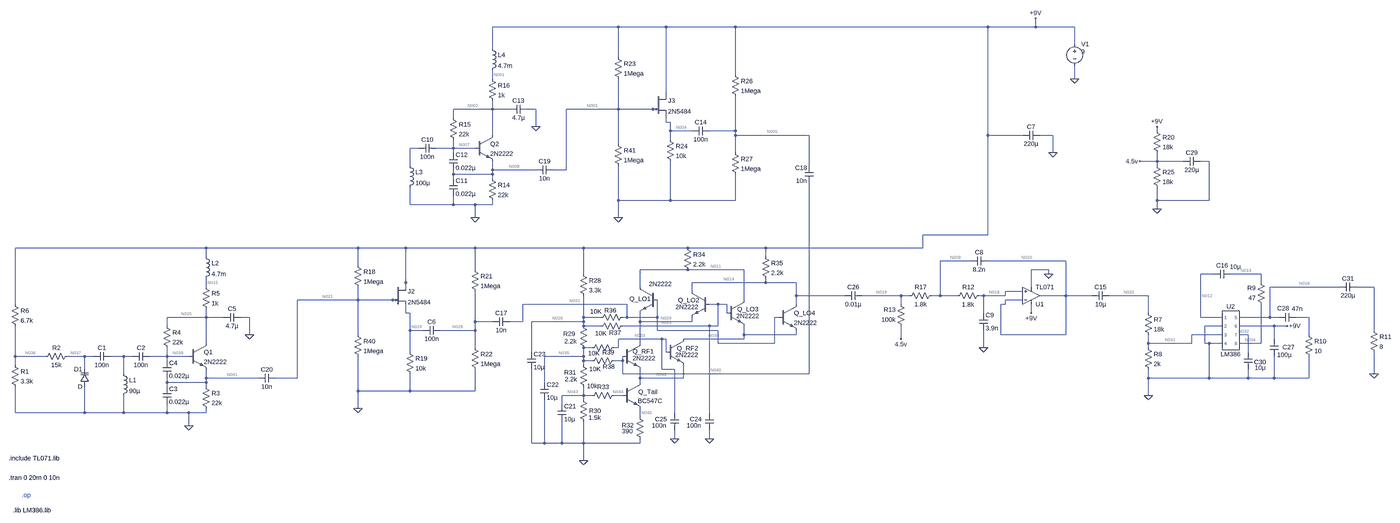
[diagram p0: schematic schm.asc, whole sheet]
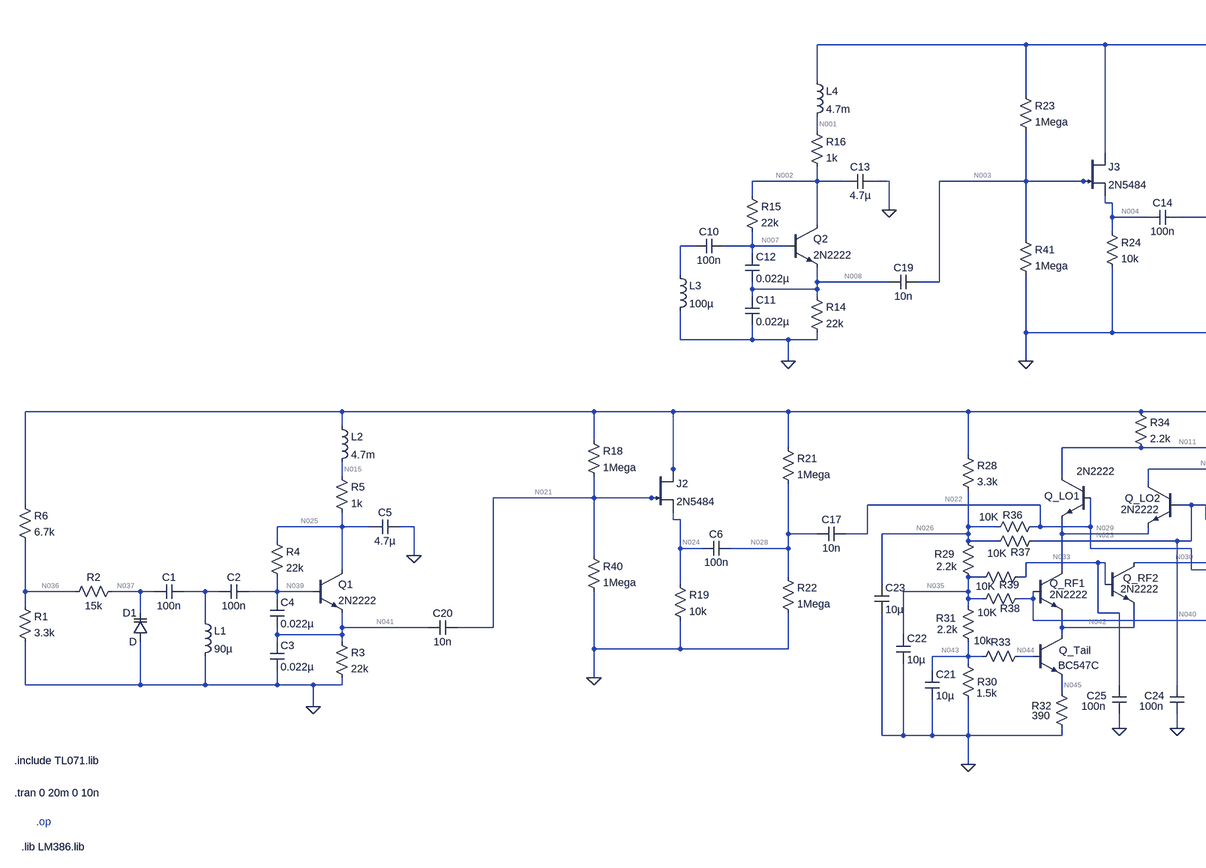
[diagram p1: schematic schm.asc, part, row 1 of 1, column 1 of 2]
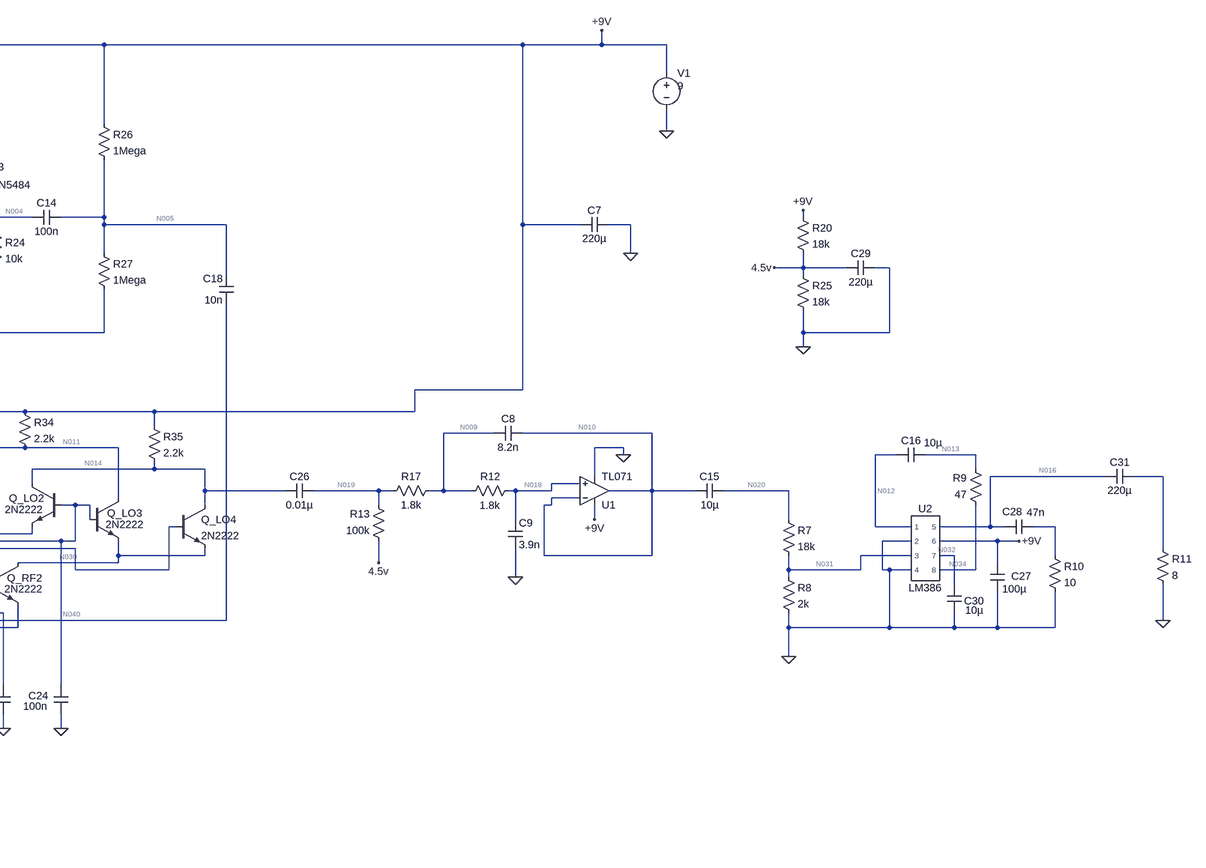
[diagram p2: schematic schm.asc, part, row 1 of 1, column 2 of 2]
schm.asc, the LTspice schematic file:
Version 4.1
SHEET 1 2980 824
WIRE -256 -976 -720 -976
WIRE -80 -976 -256 -976
WIRE 176 -976 -80 -976
WIRE 1120 -976 176 -976
WIRE 1296 -976 1296 -1008
WIRE 1296 -976 1120 -976
WIRE 1440 -976 1296 -976
WIRE 1440 -912 1440 -976
WIRE -720 -896 -720 -976
WIRE -256 -864 -256 -976
WIRE 176 -800 176 -976
WIRE -720 -784 -720 -816
WIRE 1440 -784 1440 -832
WIRE -80 -736 -80 -976
WIRE -720 -672 -720 -704
WIRE -720 -672 -864 -672
WIRE -656 -672 -720 -672
WIRE -560 -672 -592 -672
WIRE -256 -672 -256 -784
WIRE -256 -672 -448 -672
WIRE -128 -672 -256 -672
WIRE -112 -672 -128 -672
WIRE -864 -640 -864 -672
WIRE -80 -624 -80 -640
WIRE -64 -624 -80 -624
WIRE -560 -608 -560 -672
WIRE -64 -592 -64 -624
WIRE 16 -592 -64 -592
WIRE 176 -592 176 -720
WIRE 176 -592 80 -592
WIRE 1744 -592 1744 -608
WIRE -720 -576 -720 -672
WIRE 176 -576 176 -592
WIRE 448 -576 176 -576
WIRE 1120 -576 1120 -976
WIRE 1248 -576 1120 -576
WIRE 1360 -576 1312 -576
WIRE -64 -560 -64 -592
WIRE -256 -544 -256 -672
WIRE -992 -528 -1024 -528
WIRE -864 -528 -864 -560
WIRE -864 -528 -928 -528
WIRE -784 -528 -864 -528
WIRE -864 -512 -864 -528
WIRE 176 -512 176 -576
WIRE 1360 -512 1360 -576
WIRE 1744 -480 1744 -512
WIRE 1744 -480 1680 -480
WIRE 1840 -480 1744 -480
WIRE 1936 -480 1904 -480
WIRE -1024 -464 -1024 -528
WIRE 448 -464 448 -576
WIRE 1744 -464 1744 -480
WIRE -720 -448 -720 -480
WIRE -560 -448 -720 -448
WIRE -448 -448 -448 -672
WIRE -448 -448 -496 -448
WIRE -864 -432 -864 -448
WIRE -720 -432 -720 -448
WIRE -720 -432 -864 -432
WIRE -864 -416 -864 -432
WIRE -720 -416 -720 -432
WIRE -256 -336 -256 -464
WIRE -64 -336 -64 -480
WIRE -64 -336 -256 -336
WIRE 176 -336 176 -432
WIRE 176 -336 -64 -336
WIRE 1744 -336 1744 -384
WIRE 1936 -336 1936 -480
WIRE 1936 -336 1744 -336
WIRE -1024 -320 -1024 -384
WIRE -864 -320 -864 -352
WIRE -864 -320 -1024 -320
WIRE -784 -320 -864 -320
WIRE -720 -320 -720 -336
WIRE -720 -320 -784 -320
WIRE 1744 -304 1744 -336
WIRE -784 -272 -784 -320
WIRE -256 -272 -256 -336
WIRE 1120 -208 1120 -576
WIRE 1120 -208 880 -208
WIRE -1776 -160 -2480 -160
WIRE -1216 -160 -1776 -160
WIRE -1040 -160 -1216 -160
WIRE -784 -160 -1040 -160
WIRE -384 -160 -784 -160
WIRE 0 -160 -384 -160
WIRE 288 -160 0 -160
WIRE 880 -160 880 -208
WIRE 880 -160 288 -160
WIRE -1776 -128 -1776 -160
WIRE 288 -128 288 -160
WIRE 1056 -112 944 -112
WIRE 1408 -112 1120 -112
WIRE -1216 -96 -1216 -160
WIRE -784 -80 -784 -160
WIRE 0 -80 -176 -80
WIRE 208 -80 0 -80
WIRE 1344 -80 1280 -80
WIRE -384 -64 -384 -160
WIRE 1344 -64 1344 -80
WIRE 1952 -64 1904 -64
WIRE 2128 -64 2016 -64
WIRE -1040 -32 -1040 -160
WIRE 288 -32 288 -48
WIRE 288 -32 16 -32
WIRE 400 -32 288 -32
WIRE 2128 -32 2128 -64
WIRE -1776 -16 -1776 -48
WIRE -1040 -16 -1040 -32
WIRE -176 -16 -176 -80
WIRE 1280 -16 1280 -80
WIRE 2416 -16 2160 -16
WIRE 2544 -16 2480 -16
WIRE 16 0 16 -32
WIRE 1248 0 1184 0
WIRE 400 16 400 -32
WIRE 592 16 400 16
WIRE 800 16 656 16
WIRE 832 16 800 16
WIRE 944 16 944 -112
WIRE 944 16 912 16
WIRE 1008 16 944 16
WIRE 1104 16 1088 16
WIRE 1184 16 1184 0
WIRE 1184 16 1104 16
WIRE 1408 16 1408 -112
WIRE 1408 16 1312 16
WIRE 1504 16 1408 16
WIRE 1712 16 1568 16
WIRE -1216 32 -1216 -16
WIRE -1216 32 -1440 32
WIRE -1088 32 -1216 32
WIRE -1072 32 -1088 32
WIRE 208 32 208 -80
WIRE 1248 32 1184 32
WIRE -2480 48 -2480 -160
WIRE -224 48 -608 48
WIRE 112 48 80 48
WIRE 144 48 112 48
WIRE 400 48 400 16
WIRE 800 48 800 16
WIRE 1184 48 1184 32
WIRE 1184 48 1168 48
WIRE -1040 80 -1040 64
WIRE -1024 80 -1040 80
WIRE 144 80 144 48
WIRE 1104 80 1104 16
WIRE 1280 80 1280 48
WIRE 1712 80 1712 16
WIRE -1776 96 -1776 64
WIRE -1776 96 -1920 96
WIRE -1712 96 -1776 96
WIRE -1616 96 -1648 96
WIRE -384 96 -384 16
WIRE -320 96 -384 96
WIRE -224 96 -224 48
WIRE -224 96 -240 96
WIRE -112 96 -112 32
WIRE -112 96 -224 96
WIRE 336 96 320 96
WIRE 1904 96 1904 -64
WIRE 1984 96 1904 96
WIRE 2160 96 2160 -16
WIRE 2160 96 2048 96
WIRE 2192 96 2160 96
WIRE 2304 96 2256 96
WIRE -784 112 -784 0
WIRE -720 112 -784 112
WIRE -608 112 -608 48
WIRE -608 112 -656 112
WIRE -384 112 -384 96
WIRE -384 112 -576 112
WIRE -176 112 -176 80
WIRE 16 112 16 96
WIRE 16 112 -176 112
WIRE -1920 128 -1920 96
WIRE -384 128 -384 112
WIRE -320 128 -384 128
WIRE 80 128 -240 128
WIRE 112 128 112 48
WIRE 112 128 80 128
WIRE 1984 128 1920 128
WIRE 2176 128 2048 128
WIRE 2224 128 2176 128
WIRE -1024 144 -1024 80
WIRE -976 144 -1024 144
WIRE -784 144 -784 112
WIRE -784 144 -912 144
WIRE -112 144 -112 96
WIRE 112 144 -112 144
WIRE 2544 144 2544 -16
WIRE -1616 160 -1616 96
WIRE -1216 160 -1216 32
WIRE 208 160 208 128
WIRE 400 160 400 144
WIRE 400 160 208 160
WIRE 1168 160 1168 48
WIRE 1408 160 1408 16
WIRE 1408 160 1168 160
WIRE 1984 160 1872 160
WIRE 2080 160 2048 160
WIRE 2304 160 2304 96
WIRE -96 176 -256 176
WIRE -80 176 -96 176
WIRE 208 176 208 160
WIRE 208 176 -16 176
WIRE 800 176 800 128
WIRE 2176 176 2176 128
WIRE -1776 192 -1776 96
WIRE -176 192 -176 112
WIRE 112 192 112 144
WIRE 320 192 320 96
WIRE 320 192 112 192
WIRE 1712 192 1712 160
WIRE 1872 192 1872 160
WIRE 1872 192 1712 192
WIRE 1920 192 1920 128
WIRE 1936 192 1920 192
WIRE 1984 192 1936 192
WIRE 2128 192 2128 48
WIRE 2128 192 2048 192
WIRE -784 208 -784 144
WIRE -352 208 -384 208
WIRE -256 208 -256 176
WIRE -256 208 -272 208
WIRE 1104 208 1104 144
WIRE 1712 208 1712 192
WIRE -1024 224 -1024 144
WIRE -576 224 -576 112
WIRE -80 224 -80 176
WIRE 2080 224 2080 160
WIRE -2480 240 -2480 128
WIRE -2368 240 -2480 240
WIRE -2224 240 -2288 240
WIRE -2192 240 -2224 240
WIRE -2080 240 -2128 240
WIRE -2048 240 -2080 240
WIRE -1920 240 -1920 208
WIRE -1920 240 -1984 240
WIRE -1840 240 -1920 240
WIRE -384 240 -384 208
WIRE -384 240 -528 240
WIRE -1920 256 -1920 240
WIRE -384 256 -384 240
WIRE -352 256 -384 256
WIRE -240 256 -240 240
WIRE -240 256 -272 256
WIRE -2480 272 -2480 240
WIRE -384 272 -384 256
WIRE -2224 288 -2224 240
WIRE -96 288 -96 176
WIRE -48 288 -96 288
WIRE -2080 304 -2080 240
WIRE -240 304 -240 256
WIRE 448 304 448 -400
WIRE 448 304 -240 304
WIRE 2544 304 2544 224
WIRE -1776 320 -1776 288
WIRE -1584 320 -1776 320
WIRE -1440 320 -1440 32
WIRE -1440 320 -1520 320
WIRE -176 320 -176 288
WIRE -16 320 -16 272
WIRE -16 320 -176 320
WIRE 1712 320 1712 288
WIRE 1936 320 1936 192
WIRE 1936 320 1712 320
WIRE 2080 320 2080 288
WIRE 2080 320 1936 320
WIRE 2176 320 2176 240
WIRE 2176 320 2080 320
WIRE 2304 320 2304 240
WIRE 2304 320 2176 320
WIRE -1920 336 -1920 320
WIRE -1776 336 -1776 320
WIRE -1776 336 -1920 336
WIRE -528 336 -528 240
WIRE -176 336 -176 320
WIRE -1920 352 -1920 336
WIRE -1776 352 -1776 336
WIRE -1216 368 -1216 240
WIRE -1024 368 -1024 304
WIRE -1024 368 -1216 368
WIRE -784 368 -784 288
WIRE -784 368 -1024 368
WIRE -384 384 -384 352
WIRE -384 384 -464 384
WIRE -352 384 -384 384
WIRE -240 384 -272 384
WIRE 1712 384 1712 320
WIRE -384 400 -384 384
WIRE -464 416 -464 384
WIRE -1216 432 -1216 368
WIRE -2480 448 -2480 352
WIRE -2224 448 -2224 352
WIRE -2224 448 -2480 448
WIRE -2080 448 -2080 384
WIRE -2080 448 -2224 448
WIRE -1920 448 -1920 416
WIRE -1920 448 -2080 448
WIRE -1840 448 -1920 448
WIRE -1776 448 -1776 432
WIRE -1776 448 -1840 448
WIRE -48 448 -48 288
WIRE 80 448 80 128
WIRE -176 464 -176 432
WIRE -1840 496 -1840 448
WIRE -48 544 -48 512
WIRE 80 544 80 512
WIRE -576 560 -576 288
WIRE -528 560 -528 400
WIRE -528 560 -576 560
WIRE -464 560 -464 480
WIRE -464 560 -528 560
WIRE -384 560 -384 480
WIRE -384 560 -464 560
WIRE -176 560 -176 544
WIRE -176 560 -384 560
WIRE -384 624 -384 560
FLAG -1840 496 0
FLAG -1616 160 0
FLAG 1440 -784 0
FLAG 1360 -512 0
FLAG 1296 -1008 +9V
FLAG 1280 80 +9V
FLAG 1104 208 0
FLAG -784 -272 0
FLAG -560 -608 0
FLAG -1216 432 0
FLAG -256 -272 0
FLAG -384 624 0
FLAG 80 544 0
FLAG -48 544 0
FLAG 1712 384 0
FLAG 2224 128 +9V
FLAG 2544 304 0
FLAG 1344 -64 0
FLAG 1744 -608 +9V
FLAG 1744 -304 0
FLAG 1680 -480 4.5v
FLAG 800 176 4.5v
SYMBOL res -2496 256 R0
SYMATTR InstName R1
SYMATTR Value 3.3k
SYMBOL res -2272 224 R90
WINDOW 0 0 56 VBottom 2
WINDOW 3 32 56 VTop 2
SYMATTR InstName R2
SYMATTR Value 15k
SYMBOL varactor -2208 352 R180
WINDOW 0 24 64 Left 2
WINDOW 3 24 0 Left 2
SYMATTR InstName D1
SYMBOL cap -2128 224 R90
WINDOW 0 0 32 VBottom 2
WINDOW 3 32 32 VTop 2
SYMATTR InstName C1
SYMATTR Value 100n
SYMBOL cap -1984 224 R90
WINDOW 0 0 32 VBottom 2
WINDOW 3 32 32 VTop 2
SYMATTR InstName C2
SYMATTR Value 100n
SYMBOL ind -2096 288 R0
SYMATTR InstName L1
SYMATTR Value 90µ
SYMATTR SpiceLine Rser=1m
SYMBOL cap -1936 352 R0
SYMATTR InstName C3
SYMATTR Value 0.022µ
SYMATTR SpiceLine V=50 Irms=0 Rser=0.0255 Lser=380p mfg="Würth Elektronik" pn="885012010015 WCAP-CSGP 1812" type="NP0"
SYMBOL cap -1936 256 R0
SYMATTR InstName C4
SYMATTR Value 0.022µ
SYMATTR SpiceLine V=10 Irms=0 Rser=0.0114 Lser=862p mfg="Würth Elektronik" pn="885012008009 WCAP-CSGP 1206" type="NP0"
SYMBOL res -1792 336 R0
SYMATTR InstName R3
SYMATTR Value 22k
SYMBOL res -1936 112 R0
SYMATTR InstName R4
SYMATTR Value 22k
SYMBOL npn -1840 192 R0
SYMATTR InstName Q1
SYMATTR Value 2N2222
SYMBOL res -1792 -32 R0
SYMATTR InstName R5
SYMATTR Value 1k
SYMBOL res -2496 32 R0
SYMATTR InstName R6
SYMATTR Value 6.7k
SYMBOL cap -1648 80 R90
WINDOW 0 0 32 VBottom 2
WINDOW 3 32 32 VTop 2
SYMATTR InstName C5
SYMATTR Value 4.7µ
SYMBOL voltage 1440 -928 R0
WINDOW 3 24 44 Left 2
WINDOW 123 0 0 Left 0
WINDOW 39 0 0 Left 0
SYMATTR Value 9
SYMATTR InstName V1
SYMBOL cap 1312 -592 R90
WINDOW 0 0 32 VBottom 2
WINDOW 3 32 32 VTop 2
SYMATTR InstName C7
SYMATTR Value 220µ
SYMBOL res 1104 0 R90
WINDOW 0 0 56 VBottom 2
WINDOW 3 33 57 VTop 2
SYMATTR InstName R12
SYMATTR Value 1.8k
SYMBOL cap 1120 -128 R90
WINDOW 0 0 32 VBottom 2
WINDOW 3 32 32 VTop 2
SYMATTR InstName C8
SYMATTR Value 8.2n
SYMBOL cap 1088 80 R0
SYMATTR InstName C9
SYMATTR Value 3.9n
SYMBOL OpAmps\\opamp2 1280 80 M180
SYMATTR InstName U1
SYMATTR Value TL071
SYMBOL res 816 144 R180
WINDOW 0 36 76 Left 2
WINDOW 3 36 40 Left 2
SYMATTR InstName R13
SYMATTR Value 100k
SYMBOL ind -1792 -144 R0
SYMATTR InstName L2
SYMATTR Value 4.7m
SYMATTR SpiceLine Ipk=0.2 Rser=10.98 Rpar=358840 Cpar=6.93p mfg="Würth Elektronik" pn="7447721047 WE-TI 8075"
SYMBOL cap -928 -544 R90
WINDOW 0 0 32 VBottom 2
WINDOW 3 32 32 VTop 2
SYMATTR InstName C10
SYMATTR Value 100n
SYMBOL ind -1040 -480 R0
SYMATTR InstName L3
SYMATTR Value 100µ
SYMATTR SpiceLine Rser=1m
SYMBOL cap -880 -416 R0
SYMATTR InstName C11
SYMATTR Value 0.022µ
SYMATTR SpiceLine V=50 Irms=0 Rser=0.0255 Lser=380p mfg="Würth Elektronik" pn="885012010015 WCAP-CSGP 1812" type="NP0"
SYMBOL cap -880 -512 R0
SYMATTR InstName C12
SYMATTR Value 0.022µ
SYMATTR SpiceLine V=10 Irms=0 Rser=0.0114 Lser=862p mfg="Würth Elektronik" pn="885012008009 WCAP-CSGP 1206" type="NP0"
SYMBOL res -736 -432 R0
SYMATTR InstName R14
SYMATTR Value 22k
SYMBOL res -880 -656 R0
SYMATTR InstName R15
SYMATTR Value 22k
SYMBOL npn -784 -576 R0
SYMATTR InstName Q2
SYMATTR Value 2N2222
SYMBOL res -736 -800 R0
SYMATTR InstName R16
SYMATTR Value 1k
SYMBOL cap -592 -688 R90
WINDOW 0 0 32 VBottom 2
WINDOW 3 32 32 VTop 2
SYMATTR InstName C13
SYMATTR Value 4.7µ
SYMBOL ind -736 -912 R0
SYMATTR InstName L4
SYMATTR Value 4.7m
SYMATTR SpiceLine Ipk=0.2 Rser=10.98 Rpar=358840 Cpar=6.93p mfg="Würth Elektronik" pn="7447721047 WE-TI 8075"
SYMBOL res 928 0 R90
WINDOW 0 0 56 VBottom 2
WINDOW 3 32 56 VTop 2
SYMATTR InstName R17
SYMATTR Value 1.8k
SYMBOL res -1232 -112 R0
SYMATTR InstName R18
SYMATTR Value 1Mega
SYMBOL res -1040 208 R0
SYMATTR InstName R19
SYMATTR Value 10k
SYMBOL njf -1088 -32 R0
SYMATTR InstName J2
SYMATTR Value 2N5484
SYMBOL res -800 -96 R0
SYMATTR InstName R21
SYMATTR Value 1Mega
SYMBOL res -800 192 R0
SYMATTR InstName R22
SYMATTR Value 1Mega
SYMBOL res -272 -880 R0
SYMATTR InstName R23
SYMATTR Value 1Mega
SYMBOL res -80 -576 R0
SYMATTR InstName R24
SYMATTR Value 10k
SYMBOL njf -128 -736 R0
SYMATTR InstName J3
SYMATTR Value 2N5484
SYMBOL res 160 -816 R0
SYMATTR InstName R26
SYMATTR Value 1Mega
SYMBOL res 160 -528 R0
SYMATTR InstName R27
SYMATTR Value 1Mega
SYMBOL cap -656 96 R90
WINDOW 0 0 32 VBottom 2
WINDOW 3 32 32 VTop 2
SYMATTR InstName C17
SYMATTR Value 10n
SYMATTR SpiceLine V=10 Irms=0 Rser=0.025 Lser=913p
SYMBOL cap 464 -400 R180
WINDOW 0 24 56 Left 2
WINDOW 3 24 8 Left 2
SYMATTR InstName C18
SYMATTR Value 10n
SYMATTR SpiceLine V=10 Irms=0 Rser=0.025 Lser=913p
SYMBOL cap -560 -432 R270
WINDOW 0 32 32 VTop 2
WINDOW 3 0 32 VBottom 2
SYMATTR InstName C19
SYMATTR Value 10n
SYMATTR SpiceLine V=10 Irms=0 Rser=0.025 Lser=913p mfg="Würth Elektronik" pn="885012008008 WCAP-CSGP 1206" type="NP0"
SYMBOL cap -1520 304 R90
WINDOW 0 0 32 VBottom 2
WINDOW 3 32 32 VTop 2
SYMATTR InstName C20
SYMATTR Value 10n
SYMATTR SpiceLine V=10 Irms=0 Rser=0.025 Lser=913p mfg="Würth Elektronik" pn="885012008008 WCAP-CSGP 1206" type="NP0"
SYMBOL npn -240 192 R0
WINDOW 0 37 30 Left 2
WINDOW 3 37 55 Left 2
SYMATTR InstName Q_RF1
SYMATTR Value 2N2222
SYMBOL npn -240 336 R0
WINDOW 0 58 35 Left 2
SYMATTR InstName Q_Tail
SYMATTR Value BC547C
SYMBOL res -400 -80 R0
SYMATTR InstName R28
SYMATTR Value 3.3k
SYMBOL res -400 112 R0
WINDOW 0 -59 45 Left 2
WINDOW 3 -55 72 Left 2
SYMATTR InstName R29
SYMATTR Value 2.2k
SYMBOL res -400 384 R0
WINDOW 0 36 57 Left 2
WINDOW 3 34 82 Left 2
SYMATTR InstName R30
SYMATTR Value 1.5k
SYMBOL res -400 256 R0
WINDOW 0 -56 43 Left 2
WINDOW 3 -53 68 Left 2
SYMATTR InstName R31
SYMATTR Value 2.2k
SYMBOL cap -480 416 R0
SYMATTR Value 10µ
SYMATTR InstName C21
SYMATTR SpiceLine V=10 Irms=23m Rser=2.4699 Lser=942p mfg="Würth Elektronik" pn="865090240001 WCAP-ASLU 4x5,5" type="Al electrolytic"
SYMBOL cap -544 336 R0
SYMATTR Value 10µ
SYMATTR InstName C22
SYMATTR SpiceLine V=10 Irms=23m Rser=2.4699 Lser=942p mfg="Würth Elektronik" pn="865090240001 WCAP-ASLU 4x5,5" type="Al electrolytic"
SYMBOL cap -592 224 R0
SYMATTR Value 10µ
SYMATTR InstName C23
SYMATTR SpiceLine V=10 Irms=23m Rser=2.4699 Lser=942p mfg="Würth Elektronik" pn="865090240001 WCAP-ASLU 4x5,5" type="Al electrolytic"
SYMBOL res -192 448 R0
WINDOW 0 -51 46 Left 2
WINDOW 3 -50 68 Left 2
SYMATTR InstName R32
SYMATTR Value 390
SYMBOL res -256 368 R90
WINDOW 0 0 56 VBottom 2
WINDOW 3 -34 96 VTop 2
SYMATTR InstName R33
SYMATTR Value 10k
SYMBOL npn -80 176 R0
WINDOW 0 40 34 Left 2
WINDOW 3 34 58 Left 2
SYMATTR InstName Q_RF2
SYMATTR Value 2N2222
SYMBOL npn -112 -16 M0
WINDOW 0 25 44 Left 2
WINDOW 3 -54 -11 Left 2
SYMATTR InstName Q_LO1
SYMATTR Value 2N2222
SYMBOL npn 80 0 M0
WINDOW 0 38 33 Left 2
WINDOW 3 40 58 Left 2
SYMATTR InstName Q_LO2
SYMATTR Value 2N2222
SYMBOL npn 144 32 R0
WINDOW 0 39 34 Left 2
WINDOW 3 35 59 Left 2
SYMATTR InstName Q_LO3
SYMATTR Value 2N2222
SYMBOL npn 336 48 R0
SYMATTR InstName Q_LO4
SYMATTR Value 2N2222
SYMBOL res -16 -176 R0
SYMATTR InstName R34
SYMATTR Value 2.2k
SYMBOL res 272 -144 R0
SYMATTR InstName R35
SYMATTR Value 2.2k
SYMBOL res -224 80 R90
WINDOW 0 6 61 VBottom 2
WINDOW 3 -21 114 VTop 2
SYMATTR InstName R36
SYMATTR Value 10K
SYMATTR SpiceLine tol=1 pwr=0.1
SYMBOL res -224 112 R90
WINDOW 0 56 44 VBottom 2
WINDOW 3 28 96 VTop 2
SYMATTR InstName R37
SYMATTR Value 10K
SYMATTR SpiceLine tol=1 pwr=0.1
SYMBOL cap 96 512 R180
WINDOW 0 44 40 Left 2
WINDOW 3 46 17 Left 2
SYMATTR InstName C24
SYMATTR Value 100n
SYMATTR SpiceLine V=10 Irms=0 Rser=0.025 Lser=913p
SYMBOL res -256 240 R90
WINDOW 0 53 35 VBottom 2
WINDOW 3 31 86 VTop 2
SYMATTR InstName R38
SYMATTR Value 10K
SYMATTR SpiceLine tol=1 pwr=0.1
SYMBOL res -256 192 R90
WINDOW 0 49 37 VBottom 2
WINDOW 3 21 90 VTop 2
SYMATTR InstName R39
SYMATTR Value 10K
SYMATTR SpiceLine tol=1 pwr=0.1
SYMBOL cap -32 512 R180
WINDOW 0 44 40 Left 2
WINDOW 3 46 17 Left 2
SYMATTR InstName C25
SYMATTR Value 100n
SYMATTR SpiceLine V=10 Irms=0 Rser=0.025 Lser=913p
SYMBOL cap 656 0 R90
WINDOW 0 0 32 VBottom 2
WINDOW 3 32 32 VTop 2
SYMATTR InstName C26
SYMATTR Value 0.01µ
SYMATTR SpiceLine V=10 Irms=0 Rser=0.025 Lser=913p mfg="Würth Elektronik" pn="885012008008 WCAP-CSGP 1206" type="NP0"
SYMBOL cap -912 128 R90
WINDOW 0 0 32 VBottom 2
WINDOW 3 32 32 VTop 2
SYMATTR InstName C6
SYMATTR Value 100n
SYMBOL cap 80 -608 R90
WINDOW 0 0 32 VBottom 2
WINDOW 3 32 32 VTop 2
SYMATTR InstName C14
SYMATTR Value 100n
SYMBOL cap 1568 0 R90
WINDOW 0 0 32 VBottom 2
WINDOW 3 32 32 VTop 2
SYMATTR InstName C15
SYMATTR Value 10µ
SYMATTR SpiceLine V=10 Irms=0 Rser=0.025 Lser=913p
SYMBOL res 1696 64 R0
SYMATTR InstName R7
SYMATTR Value 18k
SYMBOL res 1696 192 R0
SYMATTR InstName R8
SYMATTR Value 2k
SYMBOL cap 2016 -80 R90
WINDOW 0 0 32 VBottom 2
WINDOW 3 -26 -17 VTop 2
SYMATTR InstName C16
SYMATTR Value 10µ
SYMATTR SpiceLine V=10 Irms=0 Rser=0.025 Lser=913p
SYMBOL res 2144 64 R180
WINDOW 0 36 76 Left 2
WINDOW 3 36 40 Left 2
SYMATTR InstName R9
SYMATTR Value 47
SYMBOL cap 2192 240 R180
WINDOW 0 -59 34 Left 2
WINDOW 3 -49 6 Left 2
SYMATTR InstName C27
SYMATTR Value 100µ
SYMATTR SpiceLine V=10 Irms=0 Rser=0.025 Lser=913p
SYMBOL cap 2192 112 R270
WINDOW 0 34 17 VTop 2
WINDOW 3 63 69 VBottom 2
SYMATTR InstName C28
SYMATTR Value 47n
SYMATTR SpiceLine V=10 Irms=0 Rser=0.025 Lser=913p
SYMBOL res 2528 128 R0
SYMATTR InstName R11
SYMATTR Value 8
SYMBOL res 2288 144 R0
SYMATTR InstName R10
SYMATTR Value 10
SYMBOL cap 2096 288 R180
WINDOW 0 -50 27 Left 2
WINDOW 3 -49 6 Left 2
SYMATTR InstName C30
SYMATTR Value 10µ
SYMATTR SpiceLine V=10 Irms=0 Rser=0.025 Lser=913p
SYMBOL cap 2416 0 R270
WINDOW 0 32 32 VTop 2
WINDOW 3 0 32 VBottom 2
SYMATTR InstName C31
SYMATTR Value 220µ
SYMATTR SpiceLine V=10 Irms=0 Rser=0.025 Lser=913p
SYMBOL LM386 2016 144 R0
SYMATTR InstName U2
SYMBOL res 1728 -608 R0
SYMATTR InstName R20
SYMATTR Value 18k
SYMBOL res 1728 -480 R0
SYMATTR InstName R25
SYMATTR Value 18k
SYMBOL cap 1904 -496 R90
WINDOW 0 0 32 VBottom 2
WINDOW 3 32 32 VTop 2
SYMATTR InstName C29
SYMATTR Value 220µ
SYMBOL res -1232 144 R0
SYMATTR InstName R40
SYMATTR Value 1Mega
SYMBOL res -272 -560 R0
SYMATTR InstName R41
SYMATTR Value 1Mega
TEXT -2504 688 Left 2 !.tran 0 20m 0 10n
TEXT -2504 616 Left 2 !.include TL071.lib
TEXT -2456 752 Left 2 ;.op
TEXT -2488 808 Left 2 !.lib LM386.lib

The netlist it stands for:
* schm.asc
R1 N036 0 3.3k
R2 N037 N036 15k
D1 0 N037 D
C1 N038 N037 100n
C2 N039 N038 100n
L1 N038 0 90µ Rser=1m
C3 N041 0 0.022µ V=50 Irms=0 Rser=0.0255 Lser=380p mfg="Würth Elektronik" pn="885012010015 WCAP-CSGP 1812" type="NP0"
C4 N039 N041 0.022µ V=10 Irms=0 Rser=0.0114 Lser=862p mfg="Würth Elektronik" pn="885012008009 WCAP-CSGP 1206" type="NP0"
R3 N041 0 22k
R4 N025 N039 22k
Q1 N025 N039 N041 0 2N2222
R5 N015 N025 1k
R6 +9V N036 6.7k
C5 0 N025 4.7µ
V1 +9V 0 9
C7 0 +9V 220µ
R12 N018 N009 1.8k
C8 N010 N009 8.2n
C9 N018 0 3.9n
X§U1 N018 N010 +9V 0 N010 TL071  ; pins In+ In- V+ V- OUT
R13 4.5v N019 100k
L2 +9V N015 4.7m Ipk=0.2 Rser=10.98 Rpar=358840 Cpar=6.93p mfg="Würth Elektronik" pn="7447721047 WE-TI 8075"
C10 N007 N006 100n
L3 N006 0 100µ Rser=1m
C11 N008 0 0.022µ V=50 Irms=0 Rser=0.0255 Lser=380p mfg="Würth Elektronik" pn="885012010015 WCAP-CSGP 1812" type="NP0"
C12 N007 N008 0.022µ V=10 Irms=0 Rser=0.0114 Lser=862p mfg="Würth Elektronik" pn="885012008009 WCAP-CSGP 1206" type="NP0"
R14 N008 0 22k
R15 N002 N007 22k
Q2 N002 N007 N008 0 2N2222
R16 N001 N002 1k
C13 0 N002 4.7µ
L4 +9V N001 4.7m Ipk=0.2 Rser=10.98 Rpar=358840 Cpar=6.93p mfg="Würth Elektronik" pn="7447721047 WE-TI 8075"
R17 N009 N019 1.8k
R18 +9V N021 1Mega
R19 N024 0 10k
J2 +9V N021 N024 2N5484
R21 +9V N028 1Mega
R22 N028 0 1Mega
R23 +9V N003 1Mega
R24 N004 0 10k
J3 +9V N003 N004 2N5484
R26 +9V N005 1Mega
R27 N005 0 1Mega
C17 N022 N028 10n V=10 Irms=0 Rser=0.025 Lser=913p
C18 N040 N005 10n V=10 Irms=0 Rser=0.025 Lser=913p
C19 N008 N003 10n V=10 Irms=0 Rser=0.025 Lser=913p mfg="Würth Elektronik" pn="885012008008 WCAP-CSGP 1206" type="NP0"
C20 N021 N041 10n V=10 Irms=0 Rser=0.025 Lser=913p mfg="Würth Elektronik" pn="885012008008 WCAP-CSGP 1206" type="NP0"
Q_RF1 N029 N040 N042 0 2N2222
Q_Tail N042 N044 N045 0 BC547C
R28 +9V N026 3.3k
R29 N026 N035 2.2k
R30 N043 0 1.5k
R31 N035 N043 2.2k
C21 N043 0 10µ V=10 Irms=23m Rser=2.4699 Lser=942p mfg="Würth Elektronik" pn="865090240001 WCAP-ASLU 4x5,5" type="Al electrolytic"
C22 N035 0 10µ V=10 Irms=23m Rser=2.4699 Lser=942p mfg="Würth Elektronik" pn="865090240001 WCAP-ASLU 4x5,5" type="Al electrolytic"
C23 N026 0 10µ V=10 Irms=23m Rser=2.4699 Lser=942p mfg="Würth Elektronik" pn="865090240001 WCAP-ASLU 4x5,5" type="Al electrolytic"
R32 N045 0 390
R33 N044 N043 10k
Q_RF2 N030 N033 N042 0 2N2222
Q_LO1 N011 N022 N029 0 2N2222
Q_LO2 N014 N023 N029 0 2N2222
Q_LO3 N011 N023 N030 0 2N2222
Q_LO4 N014 N022 N030 0 2N2222
R34 +9V N011 2.2k
R35 +9V N014 2.2k
R36 N022 N026 10K tol=1 pwr=0.1
R37 N023 N026 10K tol=1 pwr=0.1
C24 0 N023 100n V=10 Irms=0 Rser=0.025 Lser=913p
R38 N040 N035 10K tol=1 pwr=0.1
R39 N033 N035 10K tol=1 pwr=0.1
C25 0 N033 100n V=10 Irms=0 Rser=0.025 Lser=913p
C26 N019 N014 0.01µ V=10 Irms=0 Rser=0.025 Lser=913p mfg="Würth Elektronik" pn="885012008008 WCAP-CSGP 1206" type="NP0"
C6 N028 N024 100n
C14 N005 N004 100n
C15 N020 N010 10µ V=10 Irms=0 Rser=0.025 Lser=913p
R7 N020 N031 18k
R8 N031 0 2k
C16 N013 N012 10µ V=10 Irms=0 Rser=0.025 Lser=913p
R9 N034 N013 47
C27 0 +9V 100µ V=10 Irms=0 Rser=0.025 Lser=913p
C28 N016 N027 47n V=10 Irms=0 Rser=0.025 Lser=913p
R11 N017 0 8
R10 N027 0 10
C30 0 N032 10µ V=10 Irms=0 Rser=0.025 Lser=913p
C31 N016 N017 220µ V=10 Irms=0 Rser=0.025 Lser=913p
X§U2 N012 0 N031 0 N016 +9V N032 N034 LM386  ; pins 1 2 3 4 5 6 7 8
R20 +9V 4.5v 18k
R25 4.5v 0 18k
C29 0 4.5v 220µ
R40 N021 0 1Mega
R41 N003 0 1Mega
.model D D
.lib standard.dio
.model NPN NPN
.model PNP PNP
.lib standard.bjt
.model NJF NJF
.model PJF PJF
.lib standard.jft
.tran 0 20m 0 10n
.include TL071.lib
* .op
.lib LM386.lib
.lib lm386.lib
.backanno
.end

* Results of the author's LTspice run, read from the files saved beside the schematic
* Operating Point, zero values left out:
*   V(+9v) = 9 V
*   V(4.5v) = 4.5 V
*   V(n001) = 8.996 V
*   V(n002) = 8.634 V
*   V(n003) = 4.5 V
*   V(n004) = 5.571 V
*   V(n005) = 4.5 V
*   V(n007) = 8.594 V
*   V(n008) = 7.965 V
*   V(n009) = 4.5 V
*   V(n010) = 4.5 V
*   V(n011) = 6.863 V
*   V(n012) = 1.107 V
*   V(n013) = 1.105 V
*   V(n014) = 6.863 V
*   V(n015) = 8.996 V
*   V(n016) = 5.265 V
*   V(n018) = 4.5 V
*   V(n019) = 4.5 V
*   V(n020) = 13.3 µV
*   V(n021) = 4.5 V
*   V(n022) = 5.688 V
*   V(n023) = 5.688 V
*   V(n024) = 5.571 V
*   V(n025) = 8.634 V
*   V(n026) = 5.736 V
*   V(n028) = 4.5 V
*   V(n029) = 5.052 V
*   V(n030) = 5.052 V
*   V(n031) = 13.3 µV
*   V(n032) = 5.052 V
*   V(n033) = 3.533 V
*   V(n034) = 1.105 V
*   V(n035) = 3.582 V
*   V(n036) = 2.97 V
*   V(n037) = 2.97 V
*   V(n039) = 8.594 V
*   V(n040) = 3.533 V
*   V(n041) = 7.965 V
*   V(n042) = 2.879 V
*   V(n043) = 1.448 V
*   V(n044) = 1.406 V
*   V(n045) = 766.7 mV
*   I(D1) = -2.98 pA
*   I(L2) = 362.1 µA
*   I(L4) = 362.1 µA
*   I(R1) = 900 µA
*   I(R12) = -34.55 pA
*   I(R13) = 34.55 pA
*   I(R14) = 362.1 µA
*   I(R15) = 1.803 µA
*   I(R16) = 362.1 µA
*   I(R17) = -34.55 pA
*   I(R18) = 4.5 µA
*   I(R19) = 557.1 µA
*   I(R2) = -2.98 pA
*   I(R20) = 250 µA
*   I(R21) = 4.5 µA
*   I(R22) = 4.5 µA
*   I(R23) = 4.5 µA
*   I(R24) = 557.1 µA
*   I(R25) = 250 µA
*   I(R26) = 4.5 µA
*   I(R27) = 4.5 µA
*   I(R28) = 989 µA
*   I(R29) = 979.4 µA
*   I(R3) = 362.1 µA
*   I(R30) = 965.5 µA
*   I(R31) = 969.7 µA
*   I(R32) = 1.966 mA
*   I(R33) = -4.241 µA
*   I(R34) = 971.2 µA
*   I(R35) = 971.2 µA
*   I(R36) = -4.807 µA
*   I(R37) = -4.807 µA
*   I(R38) = -4.822 µA
*   I(R39) = -4.822 µA
*   I(R4) = 1.803 µA
*   I(R40) = 4.5 µA
*   I(R41) = 4.5 µA
*   I(R5) = 362.1 µA
*   I(R6) = 900 µA
*   I(R8) = 6.651 nA
*   I(V1) = -26.45 mA
*   Ib(Q1) = 1.803 µA
*   Ib(Q2) = 1.803 µA
*   Ib(Q_LO1) = 2.404 µA
*   Ib(Q_LO2) = 2.404 µA
*   Ib(Q_LO3) = 2.404 µA
*   Ib(Q_LO4) = 2.404 µA
*   Ib(Q_RF1) = 4.822 µA
*   Ib(Q_RF2) = 4.822 µA
*   Ib(Q_Tail) = 4.241 µA
*   Ic(Q1) = 360.3 µA
*   Ic(Q2) = 360.3 µA
*   Ic(Q_LO1) = 485.6 µA
*   Ic(Q_LO2) = 485.6 µA
*   Ic(Q_LO3) = 485.6 µA
*   Ic(Q_LO4) = 485.6 µA
*   Ic(Q_RF1) = 976 µA
*   Ic(Q_RF2) = 976 µA
*   Ic(Q_Tail) = 1.962 mA
*   Id(J2) = 557.1 µA
*   Id(J3) = 557.1 µA
*   Ie(Q1) = -362.1 µA
*   Ie(Q2) = -362.1 µA
*   Ie(Q_LO1) = -488 µA
*   Ie(Q_LO2) = -488 µA
*   Ie(Q_LO3) = -488 µA
*   Ie(Q_LO4) = -488 µA
*   Ie(Q_RF1) = -980.8 µA
*   Ie(Q_RF2) = -980.8 µA
*   Ie(Q_Tail) = -1.966 mA
*   Ig(J2) = -6.071 pA
*   Ig(J3) = -6.071 pA
*   Is(J2) = -557.1 µA
*   Is(J3) = -557.1 µA
*   Ix(u1:1) = 34.55 pA
*   Ix(u1:2) = 34.55 pA
*   Ix(u1:3) = 4.395 mA
*   Ix(u1:4) = -4.395 mA
*   Ix(u1:5) = -34.55 pA
*   Ix(u2:2) = -6.633 nA
*   Ix(u2:3) = -6.651 nA
*   Ix(u2:4) = -16.12 mA
*   Ix(u2:6) = 16.12 mA